# Altium schematic sheet ADC.SchDoc
size A3
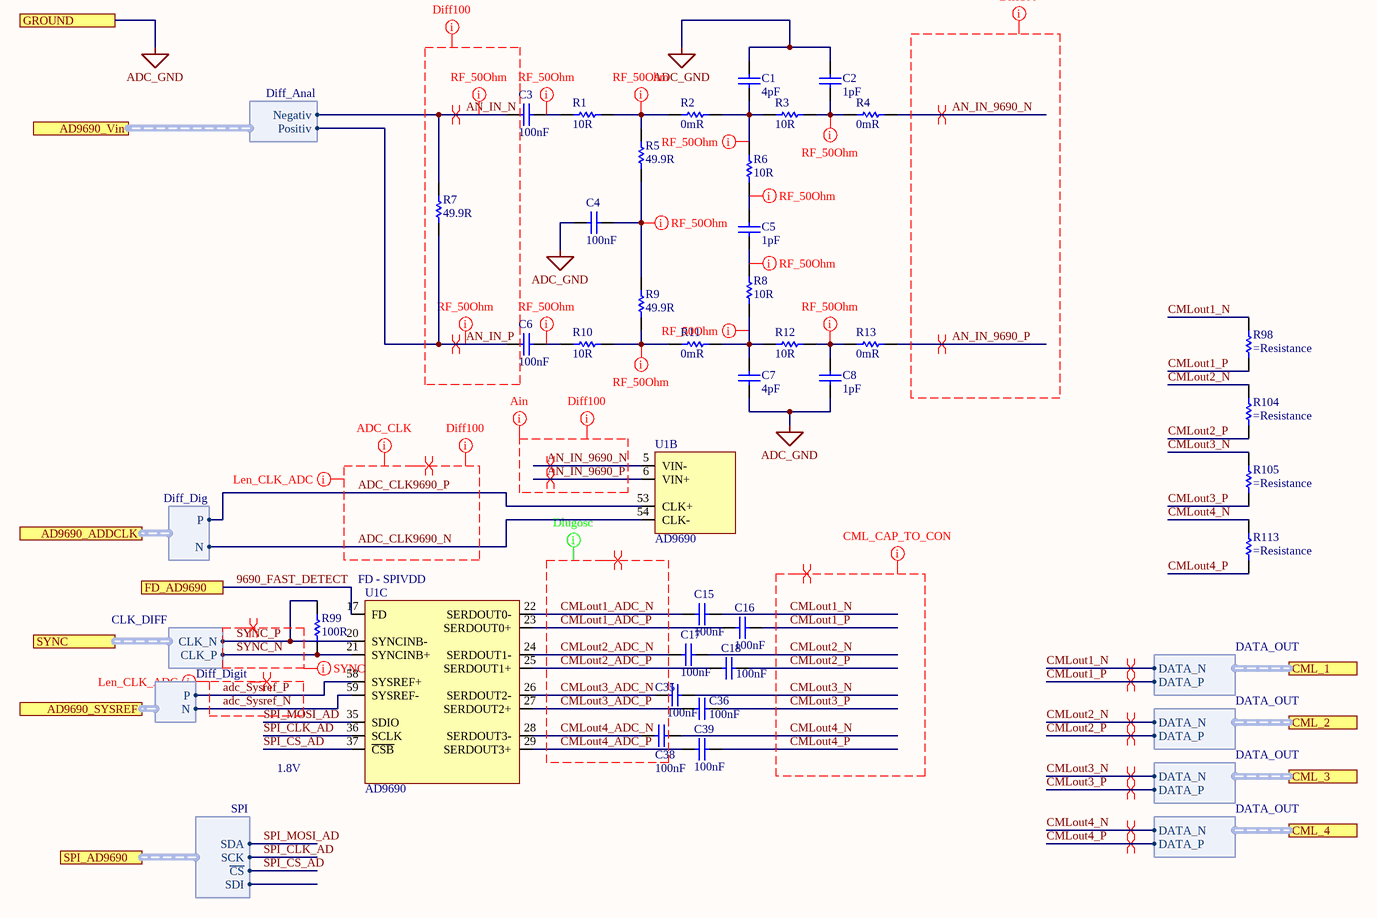
[diagram p0: ADC.SchDoc]

## Parts
C1  4pF  [CAP 0201/0603 KK]
C2  1pF  [CAP 0201/0603 KK]
C3  100nF  [CAP 0201/0603 KK]
C4  100nF  [CAP 0201/0603 KK]
C5  1pF  [CAP 0201/0603 KK]
C6  100nF  [CAP 0201/0603 KK]
C7  4pF  [CAP 0201/0603 KK]
C8  1pF  [CAP 0201/0603 KK]
C15  100nF  [CAP 0201/0603 KK]
C16  100nF  [CAP 0201/0603 KK]
C17  100nF  [CAP 0201/0603 KK]
C18  100nF  [CAP 0201/0603 KK]
C35  100nF  [CAP 0201/0603 KK]
C36  100nF  [CAP 0201/0603 KK]
C38  100nF  [CAP 0201/0603 KK]
C39  100nF  [CAP 0201/0603 KK]
R1  10R  [RES 0201/0603]
R2  0mR  [RES 0402/1005 RF KK]
R3  10R  [RES 0201/0603]
R4  0mR  [RES 0402/1005 RF KK]
R5  49.9R  [RES 0201/0603]
R6  10R  [RES 0201/0603]
R7  49.9R  [RES 0201/0603]
R8  10R  [RES 0201/0603]
R9  49.9R  [RES 0201/0603]
R10  10R  [RES 0201/0603]
R11  0mR  [RES 0402/1005 RF KK]
R12  10R  [RES 0201/0603]
R13  0mR  [RES 0402/1005 RF KK]
R98  (no value)  [RES 0402/1005 RF KK]
R99  100R  [RES 0201/0603]
R104  (no value)  [RES 0402/1005 RF KK]
R105  (no value)  [RES 0402/1005 RF KK]
R113  (no value)  [RES 0402/1005 RF KK]
U1  AD9690  [AD9690]  (parts B,C of 3)

## Ports
AD9690_ADDCLK (harness Diff_Dig), AD9690_SYSREF (harness Diff_Digit), AD9690_Vin (harness Diff_Anal), CML_1 (harness DATA_OUT), CML_2 (harness DATA_OUT), CML_3 (harness DATA_OUT), CML_4 (harness DATA_OUT), FD_AD9690, GROUND, SPI_AD9690 (harness SPI), SYNC (harness CLK_DIFF)

## Harnesses
Diff_Anal: Negativ, Positiv
Diff_Dig: N, P
Diff_Digit: N, P
CLK_DIFF: CLK_P, CLK_N
DATA_OUT: DATA_P, DATA_N
SPI: SCK, ~{CS}, SDA, SDI

## Nets
ADC_GND: C1.2 C2.2 C4.1 C7.1 C8.1 ; port GROUND
9690_FAST_DETECT: U1.17(FD) ; port FD_AD9690
ADC_CLK9690_N: U1.54(CLK-) ; port AD9690_ADDCLK.N
ADC_CLK9690_P: U1.53(CLK+) ; port AD9690_ADDCLK.P
adc_Sysref_N: U1.59(SYSREF-) ; port AD9690_SYSREF.N
adc_Sysref_P: U1.58(SYSREF+) ; port AD9690_SYSREF.P
AN_IN_9690_N: R4.2 U1.5(VIN-)
AN_IN_9690_P: R13.2 U1.6(VIN+)
AN_IN_N: C3.1 R7.2 ; port AD9690_Vin.Negativ
AN_IN_P: C6.1 R7.1 ; port AD9690_Vin.Positiv
CMLout1_ADC_N: C15.1 U1.22(SERDOUT0-)
CMLout1_ADC_P: C16.1 U1.23(SERDOUT0+)
CMLout1_N: C15.2 R98.2 ; port CML_1.DATA_N
CMLout1_P: C16.2 R98.1 ; port CML_1.DATA_P
CMLout2_ADC_N: C17.1 U1.24(SERDOUT1-)
CMLout2_ADC_P: C18.1 U1.25(SERDOUT1+)
CMLout2_N: C17.2 R104.2 ; port CML_2.DATA_N
CMLout2_P: C18.2 R104.1 ; port CML_2.DATA_P
CMLout3_ADC_N: C35.1 U1.26(SERDOUT2-)
CMLout3_ADC_P: C36.1 U1.27(SERDOUT2+)
CMLout3_N: C35.2 R105.2 ; port CML_3.DATA_N
CMLout3_P: C36.2 R105.1 ; port CML_3.DATA_P
CMLout4_ADC_N: C38.1 U1.28(SERDOUT3-)
CMLout4_ADC_P: C39.1 U1.29(SERDOUT3+)
CMLout4_N: C38.2 R113.2 ; port CML_4.DATA_N
CMLout4_P: C39.2 R113.1 ; port CML_4.DATA_P
SPI_CLK_AD: U1.36(SCLK) ; port SPI_AD9690.SCK
SPI_CS_AD: U1.37(~{CSB}) ; port SPI_AD9690.~{CS}
SPI_MOSI_AD: U1.35(SDIO) ; port SPI_AD9690.SDA
SYNC_N: R99.1 U1.21(SYNCINB+) ; port SYNC.CLK_P
SYNC_P: R99.2 U1.20(SYNCINB-) ; port SYNC.CLK_N
NetC1_1: C1.1 R2.2 R3.1 R6.2
NetC2_1: C2.1 R3.2 R4.1
NetC3_2: C3.2 R1.1
NetC4_2: C4.2 R5.1 R9.2
NetC5_1: C5.1 R8.2
NetC5_2: C5.2 R6.1
NetC6_2: C6.2 R10.1
NetC7_2: C7.2 R8.1 R11.2 R12.1
NetC8_2: C8.2 R12.2 R13.1
NetR1_2: R1.2 R2.1 R5.2
NetR9_1: R9.1 R10.2 R11.1

## Layout directives
net class Ain: AN_IN_9690_N, AN_IN_9690_P
net class Diff_100: ADC_CLK9690_N, ADC_CLK9690_P, AN_IN_9690_N, AN_IN_9690_P, AN_IN_N, AN_IN_P
net class ADC_CLK: ADC_CLK9690_N, ADC_CLK9690_P
net class Dlugosc: CMLout1_ADC_N, CMLout1_ADC_P, CMLout2_ADC_N, CMLout2_ADC_P, CMLout3_ADC_N, CMLout3_ADC_P, CMLout4_ADC_N, CMLout4_ADC_P
differential pair; differential pair class Diff_100: ADC_CLK9690_N, ADC_CLK9690_P, adc_Sysref_N, adc_Sysref_P, AN_IN_9690_N, AN_IN_9690_P, AN_IN_N, AN_IN_P, CMLout1_ADC_N, CMLout1_ADC_P, CMLout1_N, CMLout1_P, CMLout2_ADC_N, CMLout2_ADC_P, CMLout2_N, CMLout2_P, CMLout3_ADC_N, CMLout3_ADC_P, CMLout3_N, CMLout3_P, CMLout4_ADC_N, CMLout4_ADC_P, CMLout4_N, CMLout4_P, SYNC_N, SYNC_P
net class Single50: AN_IN_N, AN_IN_P, NetC1_1, NetC2_1, NetC3_2, NetC4_2, NetC5_1, NetC5_2, NetC6_2, NetC7_2, NetC8_2, NetR1_2, NetR9_1
net class SYNC: SYNC_N, SYNC_P
net class CML_CAP_TO_CON: CMLout1_N, CMLout1_P, CMLout2_N, CMLout2_P, CMLout3_N, CMLout3_P, CMLout4_N, CMLout4_P
net class Len_CLK_ADC: ADC_CLK9690_N, ADC_CLK9690_P, adc_Sysref_N, adc_Sysref_P

## Notes on the sheet
- (near U1) FD - SPIVDD
- 1.8V
- Title
- Size:
- Date:
- A3
- Number:
- Time:
- Revision:
- Sheet
- of
- File:

## Library data of the parts
C1 C7 = Capacitor: Manufacturer 1: Murata; Manufacturer Part Number 1: GJM0335C1E4R0CB01D; Voltage Rating: 25V; Dielectric: C0G; Supplier 1: Digi-Key; Supplier Part Number 1: 490-3068-1-ND; Stock 1: 33697; Pricing 1: 1=0.10000, 10=0.07300, 100=0.03240, 500=0.02318, 1000=0.01821, 2500=0.01655, 5000=0.01523 (USD); RoHS: Yes; Mount: Surface Mount; Case/Package: 0201; Case Code (Metric): 0603; Case Code (Imperial): 0201; Min Operating Temperature: -55°C; Max Operating Temperature: 125°C; Capacitance: 4pF; Packaging: Tape and Reel; Package Quantity: 1; Voltage Rating (DC): 25V; Termination: SMD/SMT; Length: 0.6mm; Height: 0.3mm; Width: 0.012inch; Thickness: 0.013inch; Depth: 0.3mm; Radiation Hardening: No; Lead Free: Lead Free; ComponentLink1URL: https://datasheet.ciiva.com/133/product-133426.pdf?src-supplier=Digi-Key; ComponentLink1Description: https://datasheet.ciiva.com/133/product-133426.pdf?src-supplier=Digi-Key; ComponentLink2URL: https://datasheet.ciiva.com/133/partnumbering-e-01-133427.pdf?src-supplier=Digi-Key; ComponentLink2Description: https://datasheet.ciiva.com/133/partnumbering-e-01-133427.pdf?src-supplier=Digi-Key; ComponentLink3URL: https://datasheet.ciiva.com/133/partnumbering-e-01-133428.pdf?src-supplier=Digi-Key; ComponentLink3Description: https://datasheet.ciiva.com/133/partnumbering-e-01-133428.pdf?src-supplier=Digi-Key; ComponentLink4URL: https://datasheet.ciiva.com/16467/l0005e-16467449.pdf?src-supplier=Future+Electronics; ComponentLink4Description: https://datasheet.ciiva.com/16467/l0005e-16467449.pdf?src-supplier=Future+Electronics; ComponentLink5URL: https://datasheet.ciiva.com/11613/product-11613563.pdf?src-supplier=Avnet; ComponentLink5Description: https://datasheet.ciiva.com/11613/product-11613563.pdf?src-supplier=Avnet
C2 C5 C8 = Capacitor: Manufacturer 1: Murata; Manufacturer Part Number 1: GRM0335C1E1R0CA01D; Voltage Rating: 25V; Dielectric: C0G; Supplier 1: Digi-Key; Supplier Part Number 1: 490-7749-1-ND; Stock 1: 33122; Pricing 1: 1=0.10000, 10=0.01500, 100=0.00680, 500=0.00484, 1000=0.00380, 2500=0.00345, 5000=0.00317 (USD); RoHS: Yes; Mount: Surface Mount; Case/Package: 0201; Case Code (Metric): 0603; Case Code (Imperial): 0201; Min Operating Temperature: -55°C; Max Operating Temperature: 125°C; Capacitance: 1pF; Package Quantity: 15000; Packaging: Tape and Reel; Voltage Rating (DC): 25V; Termination: SMD/SMT; Length: 0.6mm; Height: 0.3mm; Width: 0.012inch; Thickness: 0.013inch; Depth: 0.3mm; REACH SVHC: No SVHC; Lead Free: Lead Free; ComponentLink1URL: https://datasheet.ciiva.com/29540/partnumbering-e-01-29540585.pdf?src-supplier=Digi-Key; ComponentLink1Description: https://datasheet.ciiva.com/29540/partnumbering-e-01-29540585.pdf?src-supplier=Digi-Key; ComponentLink2URL: https://datasheet.ciiva.com/29540/partnumbering-e-01-29540586.pdf?src-supplier=Digi-Key; ComponentLink2Description: https://datasheet.ciiva.com/29540/partnumbering-e-01-29540586.pdf?src-supplier=Digi-Key; ComponentLink3URL: https://datasheet.ciiva.com/29540/partnumbering-e-01-29540587.pdf?src-supplier=Digi-Key; ComponentLink3Description: https://datasheet.ciiva.com/29540/partnumbering-e-01-29540587.pdf?src-supplier=Digi-Key
C3 C4 C6 = Capacitor: Manufacturer 1: Yageo; Manufacturer Part Number 1: CC0201KRX5R6BB104; Voltage Rating (DC): 10V; Tolerance: 10%; Dielectric: X5R; Supplier 1: Digi-Key; Supplier Part Number 1: 311-1593-1-ND; Stock 1: 1229391; Pricing 1: 1=0.10000, 10=0.03800, 100=0.01690, 500=0.01208, 1000=0.00949, 2500=0.00862, 5000=0.00794 (USD); RoHS: Yes; Mount: Surface Mount; Case/Package: 0201; Weight: 6E-06oz; Case Code (Imperial): 0201; Case Code (Metric): 0603; Min Operating Temperature: -55°C; Max Operating Temperature: 85°C; Capacitance: 100nF; Packaging: Tape and Reel; Termination: SMD/SMT; Composition: Ceramic; Voltage Rating: 10V; Length: 0.6mm; Height: 0.3mm; Width: 0.012inch; Thickness: 0.013inch; Depth: 0.3mm; Radiation Hardening: No; Lead Free: Lead Free; Halogen Free: Halogen Free; ComponentLink1URL: https://datasheet.ciiva.com/17437/upy-gphc-x5r-4v-to-50v-12-17437495.pdf?src-supplier=Avnet+Europe; ComponentLink1Description: https://datasheet.ciiva.com/17437/upy-gphc-x5r-4v-to-50v-12-17437495.pdf?src-supplier=Avnet+Europe; ComponentLink2URL: https://datasheet.ciiva.com/11587/upy-gphc-x5r-4v-to-50v-12-11587190.pdf?src-supplier=Avnet; ComponentLink2Description: https://datasheet.ciiva.com/11587/upy-gphc-x5r-4v-to-50v-12-11587190.pdf?src-supplier=Avnet
C15-C18 C35 C36 C38 C39 = Capacitor: Manufacturer 1: Murata; Manufacturer Part Number 1: GRM033R61C104ME84D; Voltage Rating: 16V; Tolerance: 20%; Dielectric: X5R; Supplier 1: Digi-Key; Supplier Part Number 1: 490-9986-1-ND; Stock 1: 502660; Pricing 1: 1=0.10000, 10=0.05400, 100=0.02430, 500=0.01732, 1000=0.01361, 2500=0.01238, 5000=0.01139 (USD); RoHS: Yes; Mount: Surface Mount; Case/Package: 0201; Weight: 1.2E-05oz; Case Code (Metric): 0603; Case Code (Imperial): 0201; Min Operating Temperature: -55°C; Max Operating Temperature: 85°C; Capacitance: 100nF; Packaging: Tape and Reel; Termination: SMD/SMT; Voltage Rating (DC): 16V; Package Quantity: 15000; Length: 0.024inch; Height: 0.3mm; Width: 0.3mm; Thickness: 0.013inch; ComponentLink1URL: http://www.mouser.com/ds/2/281/c02e-2905.pdf?src-supplier=Mouser; ComponentLink1Description: http://www.mouser.com/ds/2/281/c02e-2905.pdf?src-supplier=Mouser; ComponentLink2URL: http://search.murata.co.jp/Ceramy/image/img/A01X/G101/ENG/GRM033R61C104ME84-01.pdf?src-supplier=Digi-Key; ComponentLink2Description: http://search.murata.co.jp/Ceramy/image/img/A01X/G101/ENG/GRM033R61C104ME84-01.pdf?src-supplier=Digi-Key
R1 R3 R6 R8 R10 R12 = Resistor: Manufacturer 1: Panasonic; Manufacturer Part Number 1: ERJ-1GNF10R0C; Tolerance: 1%; Temperature Coefficient: 200ppm/°C; Voltage Rating: 25V; Power Rating: 50mW; Supplier 1: Farnell; Supplier Part Number 1: 2396827; Stock 1: 135000; RoHS: Yes; Mount: Surface Mount; Case/Package: 0201; Number of Pins: 2; Weight: 6E-06oz; Contact Plating: Tin,Matte; Case Code (Metric): 0603; Case Code (Imperial): 0201; Min Operating Temperature: -55°C; Max Operating Temperature: 125°C; Resistance: 10R; Composition: Thick Film; Packaging: Tape and Reel; Package Quantity: 15000; Number of Terminations: 2; Termination: SMD/SMT; Max Power Dissipation: 50mW; Voltage Rating (DC): 25V; Working Voltage: 25V; Length: 0.6mm; Height: 0.01inch; Width: 0.012inch; Radiation Hardening: No; REACH SVHC: No SVHC; Lead Free: Lead Free; ComponentLink1URL: https://datasheet.ciiva.com/17212/aoa0000ce2-17212053.pdf?src-supplier=Avnet+Europe; ComponentLink1Description: https://datasheet.ciiva.com/17212/aoa0000ce2-17212053.pdf?src-supplier=Avnet+Europe; ComponentLink2URL: https://datasheet.ciiva.com/9194/aoa0000ce2-9194214.pdf?src-supplier=Avnet; ComponentLink2Description: https://datasheet.ciiva.com/9194/aoa0000ce2-9194214.pdf?src-supplier=Avnet; ComponentLink3URL: https://datasheet.ciiva.com/16201/aoa0000ce2-16201496.pdf?src-supplier=Future+Electronics; ComponentLink3Description: https://datasheet.ciiva.com/16201/aoa0000ce2-16201496.pdf?src-supplier=Future+Electronics; ComponentLink4URL: https://datasheet.ciiva.com/16511/aoa0000ce2-16511388.pdf?src-supplier=Avnet+Asia; ComponentLink4Description: https://datasheet.ciiva.com/16511/aoa0000ce2-16511388.pdf?src-supplier=Avnet+Asia; ComponentLink5URL: https://datasheet.ciiva.com/43467/1678782-43467006.pdf?src-supplier=Farnell; ComponentLink5Description: https://datasheet.ciiva.com/43467/1678782-43467006.pdf?src-supplier=Farnell; ComponentLink6URL: https://datasheet.ciiva.com/24161/aoa0000ce2-24161967.pdf?src-supplier=Mouser; ComponentLink6Description: https://datasheet.ciiva.com/24161/aoa0000ce2-24161967.pdf?src-supplier=Mouser
R2 R4 R11 R13 = Resistor: Manufacturer 1: Yageo; Manufacturer Part Number 1: RC0402JR-070RL; Power Rating: 62.5mW; Tolerance: 5%; Voltage Rating: 50V; Max Power Dissipation: 63mW; Temperature Coefficient: 200ppm/°C; Supplier 1: Digi-Key; Supplier Part Number 1: 311-0.0JRCT-ND; Stock 1: 69822252; Pricing 1: 1=0.10000, 10=0.01200, 25=0.00920, 50=0.00680, 100=0.00510, 250=0.00388, 500=0.00308, 1000=0.00227, 5000=0.00163 (USD); RoHS: Yes; Case/Package: 0402; Contact Plating: Tin,Matte; Case Code (Metric): 1005; Case Code (Imperial): 0402; Min Operating Temperature: -55°C; Max Operating Temperature: 155°C; Resistance: 0mR; Packaging: Tape and Reel; Composition: Thick Film; Package Quantity: 1; Number of Terminations: 2; Termination: SMD/SMT; Military Standard: Not; Features: Moisture Resistant; Length: 1mm; Height: 0.016inch; Width: 0.02inch; Depth: 0.5mm; Radiation Hardening: No; REACH SVHC: Unknown; Lead Free: Lead Free; ComponentLink1URL: https://datasheet.ciiva.com/2452/pyu-rc0402-51-rohs-l-6-2452608.pdf?src-supplier=Digi-Key; ComponentLink1Description: https://datasheet.ciiva.com/2452/pyu-rc0402-51-rohs-l-6-2452608.pdf?src-supplier=Digi-Key; ComponentLink2URL: https://datasheet.ciiva.com/11808/0900766b80c66297-11808195.pdf?src-supplier=RSComponents; ComponentLink2Description: https://datasheet.ciiva.com/11808/0900766b80c66297-11808195.pdf?src-supplier=RSComponents; ComponentLink3URL: https://datasheet.ciiva.com/2452/pyu-r-int-thick-7-2452609.pdf?src-supplier=Digi-Key; ComponentLink3Description: https://datasheet.ciiva.com/2452/pyu-r-int-thick-7-2452609.pdf?src-supplier=Digi-Key; ComponentLink4URL: https://datasheet.ciiva.com/22747/1018594-22747515.pdf?src-supplier=Element14; ComponentLink4Description: https://datasheet.ciiva.com/22747/1018594-22747515.pdf?src-supplier=Element14; ComponentLink5URL: https://datasheet.ciiva.com/7983/1018594-7983535.pdf?src-supplier=Element14; ComponentLink5Description: https://datasheet.ciiva.com/7983/1018594-7983535.pdf?src-supplier=Element14; ComponentLink6URL: https://datasheet.ciiva.com/2452/pyu-r-int-thick-7-2452610.pdf?src-supplier=Digi-Key; ComponentLink6Description: https://datasheet.ciiva.com/2452/pyu-r-int-thick-7-2452610.pdf?src-supplier=Digi-Key; ComponentLink7URL: https://datasheet.ciiva.com/8896/pyu-rc0402-51-rohs-l-6-8896201.pdf?src-supplier=Avnet; ComponentLink7Description: https://datasheet.ciiva.com/8896/pyu-rc0402-51-rohs-l-6-8896201.pdf?src-supplier=Avnet; ComponentLink8URL: https://datasheet.ciiva.com/28386/pyu-rc0402-51-rohs-l-6-28386633.pdf?src-supplier=Avnet+Europe; ComponentLink8Description: https://datasheet.ciiva.com/28386/pyu-rc0402-51-rohs-l-6-28386633.pdf?src-supplier=Avnet+Europe; ComponentLink9URL: https://datasheet.ciiva.com/15189/getdatasheetpartid-326379-15189533.pdf?src-supplier=Verical; ComponentLink9Description: https://datasheet.ciiva.com/15189/getdatasheetpartid-326379-15189533.pdf?src-supplier=Verical
R5 R7 R9 = Resistor: Manufacturer 1: Panasonic; Manufacturer Part Number 1: ERJ-1GNF49R9C; Tolerance: 1%; Power Rating: 50mW; Voltage Rating: 25V; Temperature Coefficient: 200ppm/°C; Supplier 1: Digi-Key; Supplier Part Number 1: P123049CT-ND; Stock 1: 47286; Pricing 1: 1=0.10000, 10=0.05500, 100=0.02240, 1000=0.01007, 2500=0.00874, 5000=0.00722 (USD); RoHS: Yes; Mount: Surface Mount; Case/Package: 0201; Case Code (Imperial): 0201; Case Code (Metric): 0603; Contact Plating: Tin,Matte; Min Operating Temperature: -55°C; Max Operating Temperature: 125°C; Resistance: 49.9R; Packaging: Tape and Reel; Package Quantity: 15000; Composition: Thick Film; Number of Terminations: 2; Max Power Dissipation: 50mW; Working Voltage: 25V; Length: 0.6mm; Height: 0.01inch; Width: 0.3mm; Radiation Hardening: No; Lead Free: Lead Free; ComponentLink1URL: https://datasheet.ciiva.com/24033/aoa0000ce2-24033580.pdf?src-supplier=Mouser; ComponentLink1Description: https://datasheet.ciiva.com/24033/aoa0000ce2-24033580.pdf?src-supplier=Mouser; ComponentLink2URL: https://datasheet.ciiva.com/16201/aoa0000ce2-16201389.pdf?src-supplier=Future+Electronics; ComponentLink2Description: https://datasheet.ciiva.com/16201/aoa0000ce2-16201389.pdf?src-supplier=Future+Electronics
R98 R104 R105 R113 = Resistor
R99 = Resistor: Manufacturer 1: Panasonic; Manufacturer Part Number 1: ERJ-1GEF1000C; Tolerance: 1%; Power Rating: 50mW; Voltage Rating: 25V; Temperature Coefficient: 200ppm/°C; Voltage Rating (DC): 15V; Supplier 1: Mouser; Supplier Part Number 1: 667-ERJ-1GEF1000C; Stock 1: 517; Pricing 1: 1=0.10000, 10=0.03100, 100=0.01400, 1000=0.01000, 5000=0.00700, 10000=0.00600 (USD); RoHS: Yes; Mount: Surface Mount; Case/Package: 0201; Case Code (Metric): 0603; Case Code (Imperial): 0201; Contact Plating: Tin; Min Operating Temperature: -55°C; Max Operating Temperature: 125°C; Resistance: 100R; Packaging: Tape and Reel; Package Quantity: 15000; Composition: Thick Film; Number of Terminations: 2; Termination: SMD/SMT; Military Standard: Not; Max Power Dissipation: 50mW; Length: 0.6mm; Height: 0.23mm; Width: 0.012inch; Depth: 0.3mm; REACH SVHC: Unknown; Lead Free: Lead Free; ComponentLink1URL: https://datasheet.ciiva.com/16427/erj-1gef1000c-16427637.pdf?src-supplier=Future+Electronics; ComponentLink1Description: https://datasheet.ciiva.com/16427/erj-1gef1000c-16427637.pdf?src-supplier=Future+Electronics; ComponentLink2URL: https://datasheet.ciiva.com/16766/70260683-16766261.pdf?src-supplier=Allied+Electronics; ComponentLink2Description: https://datasheet.ciiva.com/16766/70260683-16766261.pdf?src-supplier=Allied+Electronics; ComponentLink3URL: https://datasheet.ciiva.com/16776/70260683-16776517.pdf?src-supplier=Allied+Electronics; ComponentLink3Description: https://datasheet.ciiva.com/16776/70260683-16776517.pdf?src-supplier=Allied+Electronics; ComponentLink4URL: https://datasheet.ciiva.com/7830/1678796-7830951.pdf?src-supplier=Element14; ComponentLink4Description: https://datasheet.ciiva.com/7830/1678796-7830951.pdf?src-supplier=Element14
U1 = AD9690: Supplier 1: Digi-Key; Supplier Part Number 1: AD9690BCPZ-500-ND